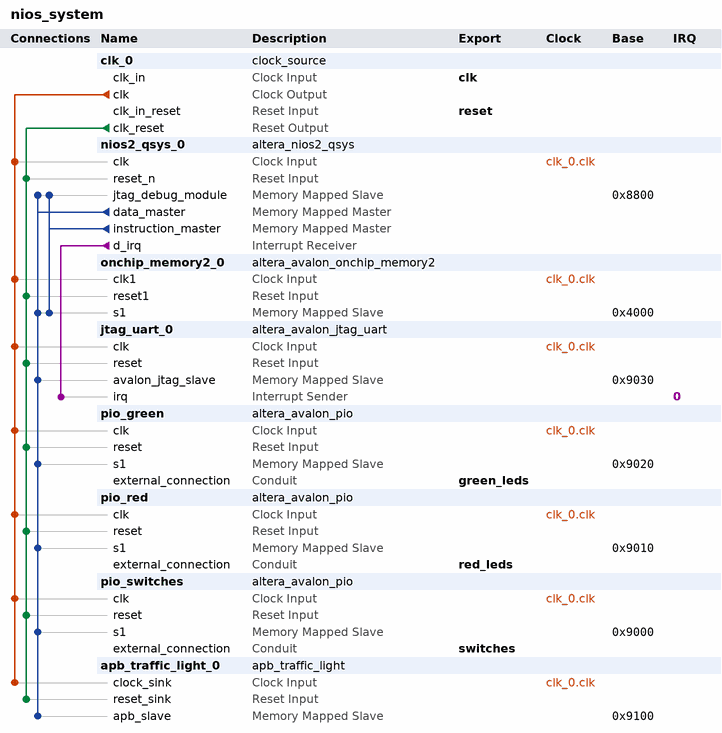
[diagram p0: system contents]
# Platform Designer (Qsys) system nios_system, Cyclone II EP2C20F484C7
# Parameters at their usual value, and those the tool derives, are not listed.
package require -exact qsys 13.0.1.99.2
create_system nios_system
set_project_property DEVICE_FAMILY {Cyclone II}
set_project_property DEVICE EP2C20F484C7

add_instance clk_0 clock_source 13.0
set_instance_parameter_value clk_0 clockFrequency 50000000

add_instance nios2_qsys_0 altera_nios2_qsys 13.0
set_instance_parameter_value nios2_qsys_0 resetSlave onchip_memory2_0.s1
set_instance_parameter_value nios2_qsys_0 mmu_TLBMissExcSlave None
set_instance_parameter_value nios2_qsys_0 exceptionSlave onchip_memory2_0.s1
set_instance_parameter_value nios2_qsys_0 breakSlave nios2_qsys_0.jtag_debug_module
set_instance_parameter_value nios2_qsys_0 impl Tiny
set_instance_parameter_value nios2_qsys_0 icache_size 4096

add_instance onchip_memory2_0 altera_avalon_onchip_memory2 13.0.1.99.2
set_instance_parameter_value onchip_memory2_0 dataWidth 32
set_instance_parameter_value onchip_memory2_0 dualPort false
set_instance_parameter_value onchip_memory2_0 initMemContent true
set_instance_parameter_value onchip_memory2_0 initializationFileName onchip_mem.hex
set_instance_parameter_value onchip_memory2_0 memorySize 16384

add_instance jtag_uart_0 altera_avalon_jtag_uart 13.0.1.99.2
set_instance_parameter_value jtag_uart_0 simInteractiveOptions NO_INTERACTIVE_WINDOWS

add_instance pio_green altera_avalon_pio 13.0.1.99.2
set_instance_parameter_value pio_green direction Output
set_instance_parameter_value pio_green width 8

add_instance pio_red altera_avalon_pio 13.0.1.99.2
set_instance_parameter_value pio_red direction Output
set_instance_parameter_value pio_red width 8

add_instance pio_switches altera_avalon_pio 13.0.1.99.2
set_instance_parameter_value pio_switches direction Input
set_instance_parameter_value pio_switches width 8

add_instance apb_traffic_light_0 apb_traffic_light 1.0

# connections
add_connection clk_0.clk apb_traffic_light_0.clock_sink clock
add_connection clk_0.clk jtag_uart_0.clk clock
add_connection clk_0.clk nios2_qsys_0.clk clock
add_connection clk_0.clk onchip_memory2_0.clk1 clock
add_connection clk_0.clk pio_green.clk clock
add_connection clk_0.clk pio_red.clk clock
add_connection clk_0.clk pio_switches.clk clock
add_connection clk_0.clk_reset apb_traffic_light_0.reset_sink reset
add_connection clk_0.clk_reset jtag_uart_0.reset reset
add_connection clk_0.clk_reset nios2_qsys_0.reset_n reset
add_connection clk_0.clk_reset onchip_memory2_0.reset1 reset
add_connection clk_0.clk_reset pio_green.reset reset
add_connection clk_0.clk_reset pio_red.reset reset
add_connection clk_0.clk_reset pio_switches.reset reset
add_connection nios2_qsys_0.data_master apb_traffic_light_0.apb_slave avalon
set_connection_parameter_value nios2_qsys_0.data_master/apb_traffic_light_0.apb_slave baseAddress 0x9100
add_connection nios2_qsys_0.data_master jtag_uart_0.avalon_jtag_slave avalon
set_connection_parameter_value nios2_qsys_0.data_master/jtag_uart_0.avalon_jtag_slave baseAddress 0x9030
add_connection nios2_qsys_0.data_master nios2_qsys_0.jtag_debug_module avalon
set_connection_parameter_value nios2_qsys_0.data_master/nios2_qsys_0.jtag_debug_module baseAddress 0x8800
add_connection nios2_qsys_0.data_master onchip_memory2_0.s1 avalon
set_connection_parameter_value nios2_qsys_0.data_master/onchip_memory2_0.s1 baseAddress 0x4000
add_connection nios2_qsys_0.data_master pio_green.s1 avalon
set_connection_parameter_value nios2_qsys_0.data_master/pio_green.s1 baseAddress 0x9020
add_connection nios2_qsys_0.data_master pio_red.s1 avalon
set_connection_parameter_value nios2_qsys_0.data_master/pio_red.s1 baseAddress 0x9010
add_connection nios2_qsys_0.data_master pio_switches.s1 avalon
set_connection_parameter_value nios2_qsys_0.data_master/pio_switches.s1 baseAddress 0x9000
add_connection nios2_qsys_0.instruction_master nios2_qsys_0.jtag_debug_module avalon
set_connection_parameter_value nios2_qsys_0.instruction_master/nios2_qsys_0.jtag_debug_module baseAddress 0x8800
add_connection nios2_qsys_0.instruction_master onchip_memory2_0.s1 avalon
set_connection_parameter_value nios2_qsys_0.instruction_master/onchip_memory2_0.s1 baseAddress 0x4000
add_connection nios2_qsys_0.d_irq jtag_uart_0.irq interrupt
set_connection_parameter_value nios2_qsys_0.d_irq/jtag_uart_0.irq irqNumber 0

# exported interfaces
add_interface clk clock sink
set_interface_property clk EXPORT_OF clk_0.clk_in
add_interface switches conduit end
set_interface_property switches EXPORT_OF pio_switches.external_connection
add_interface red_leds conduit end
set_interface_property red_leds EXPORT_OF pio_red.external_connection
add_interface green_leds conduit end
set_interface_property green_leds EXPORT_OF pio_green.external_connection
add_interface reset reset sink
set_interface_property reset EXPORT_OF clk_0.clk_in_reset

set_interconnect_requirement {$system} qsys_mm.clockCrossingAdapter HANDSHAKE
set_interconnect_requirement {$system} qsys_mm.maxAdditionalLatency 1

save_system nios_system.qsys
